# Altium schematic sheet Electrode_Sheet.SchDoc
size A4; SheetNumber: 4; SheetTotal: 4
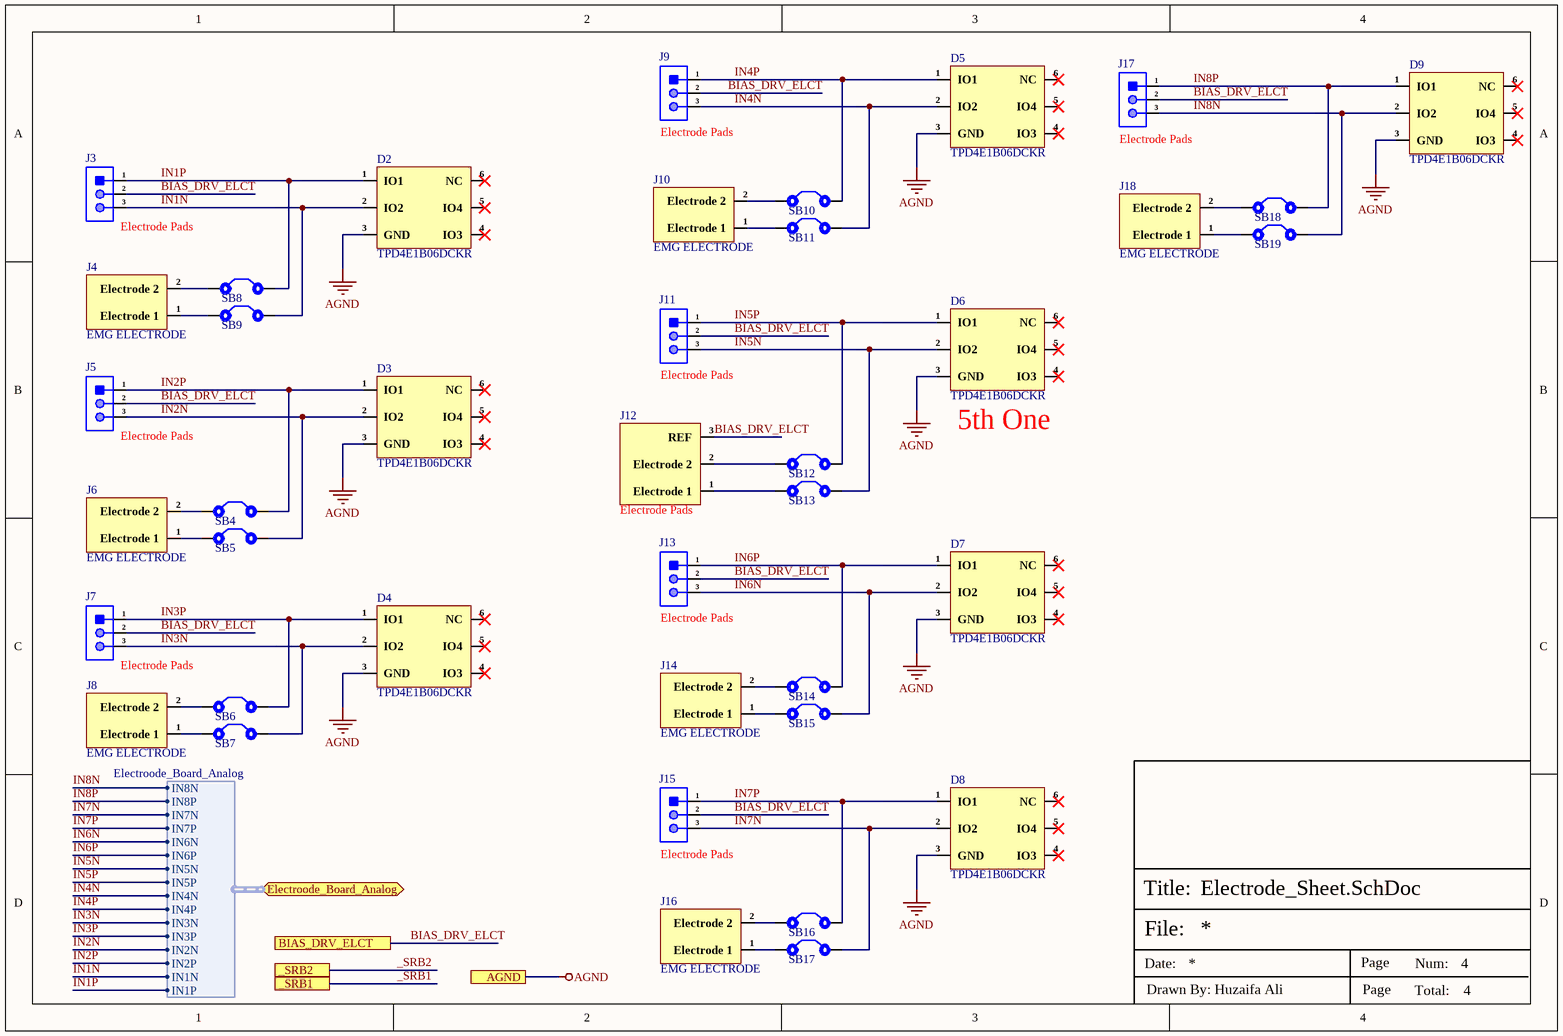
[diagram p0: Electrode_Sheet.SchDoc]

## Parts
D2  TPD4E1B06DCKR  [SOT-363]
D3  TPD4E1B06DCKR  [SOT-363]
D4  TPD4E1B06DCKR  [SOT-363]
D5  TPD4E1B06DCKR  [SOT-363]
D6  TPD4E1B06DCKR  [SOT-363]
D7  TPD4E1B06DCKR  [SOT-363]
D8  TPD4E1B06DCKR  [SOT-363]
D9  TPD4E1B06DCKR  [SOT-363]
J3  Test Pad SMD 3 Pin  [Test Pad (SMD 3 Pin)]  (value not drawn)  (no BOM)
J4  EMG ELECTRODE  [EMG 2 PAD]
J5  Test Pad SMD 3 Pin  [Test Pad (SMD 3 Pin)]  (value not drawn)  (no BOM)
J6  EMG ELECTRODE  [EMG 2 PAD]
J7  Test Pad SMD 3 Pin  [Test Pad (SMD 3 Pin)]  (value not drawn)  (no BOM)
J8  EMG ELECTRODE  [EMG 2 PAD]
J9  Test Pad SMD 3 Pin  [Test Pad (SMD 3 Pin)]  (value not drawn)  (no BOM)
J10  EMG ELECTRODE  [EMG 2 PAD]
J11  Test Pad SMD 3 Pin  [Test Pad (SMD 3 Pin)]  (value not drawn)  (no BOM)
J12  Electrode Pads  [EMG 3 Pad]
J13  Test Pad SMD 3 Pin  [Test Pad (SMD 3 Pin)]  (value not drawn)  (no BOM)
J14  EMG ELECTRODE  [EMG 2 PAD]
J15  Test Pad SMD 3 Pin  [Test Pad (SMD 3 Pin)]  (value not drawn)  (no BOM)
J16  EMG ELECTRODE  [EMG 2 PAD]
J17  Test Pad SMD 3 Pin  [Test Pad (SMD 3 Pin)]  (value not drawn)  (no BOM)
J18  EMG ELECTRODE  [EMG 2 PAD]
SB4  Solder Bridge 0603  [Solder Bridge]  (value not drawn)  (no BOM)
SB5  Solder Bridge 0603  [Solder Bridge]  (value not drawn)  (no BOM)
SB6  Solder Bridge 0603  [Solder Bridge]  (value not drawn)  (no BOM)
SB7  Solder Bridge 0603  [Solder Bridge]  (value not drawn)  (no BOM)
SB8  Solder Bridge 0603  [Solder Bridge]  (value not drawn)  (no BOM)
SB9  Solder Bridge 0603  [Solder Bridge]  (value not drawn)  (no BOM)
SB10  Solder Bridge 0603  [Solder Bridge]  (value not drawn)  (no BOM)
SB11  Solder Bridge 0603  [Solder Bridge]  (value not drawn)  (no BOM)
SB12  Solder Bridge 0603  [Solder Bridge]  (value not drawn)  (no BOM)
SB13  Solder Bridge 0603  [Solder Bridge]  (value not drawn)  (no BOM)
SB14  Solder Bridge 0603  [Solder Bridge]  (value not drawn)  (no BOM)
SB15  Solder Bridge 0603  [Solder Bridge]  (value not drawn)  (no BOM)
SB16  Solder Bridge 0603  [Solder Bridge]  (value not drawn)  (no BOM)
SB17  Solder Bridge 0603  [Solder Bridge]  (value not drawn)  (no BOM)
SB18  Solder Bridge 0603  [Solder Bridge]  (value not drawn)  (no BOM)
SB19  Solder Bridge 0603  [Solder Bridge]  (value not drawn)  (no BOM)

## Ports
_SRB1, _SRB2, AGND, BIAS_DRV_ELCT, Electroode_Board_Analog (bidir, harness Electroode_Board_Analog)

## Harnesses
Electroode_Board_Analog: IN8N, IN8P, IN7N, IN7P, IN6N, IN6P, IN5N, IN5P, IN4N, IN4P, IN3N, IN3P, IN2N, IN2P, IN1N, IN1P

## Nets
AGND: D2.3(GND) D3.3(GND) D4.3(GND) D5.3(GND) D6.3(GND) D7.3(GND) D8.3(GND) D9.3(GND) ; port AGND
_SRB1: port _SRB1
_SRB2: port _SRB2
BIAS_DRV_ELCT: J3.2 J5.2 J7.2 J9.2 J11.2 J12.3(REF) J13.2 J15.2 J17.2 ; port BIAS_DRV_ELCT
IN1N: D2.2(IO2) J3.3 SB9.2 ; port Electroode_Board_Analog.IN1N
IN1P: D2.1(IO1) J3.1 SB8.2 ; port Electroode_Board_Analog.IN1P
IN2N: D3.2(IO2) J5.3 SB5.2 ; port Electroode_Board_Analog.IN2N
IN2P: D3.1(IO1) J5.1 SB4.2 ; port Electroode_Board_Analog.IN2P
IN3N: D4.2(IO2) J7.3 SB7.2 ; port Electroode_Board_Analog.IN3N
IN3P: D4.1(IO1) J7.1 SB6.2 ; port Electroode_Board_Analog.IN3P
IN4N: D5.2(IO2) J9.3 SB11.2 ; port Electroode_Board_Analog.IN4N
IN4P: D5.1(IO1) J9.1 SB10.2 ; port Electroode_Board_Analog.IN4P
IN5N: D6.2(IO2) J11.3 SB13.2 ; port Electroode_Board_Analog.IN5N
IN5P: D6.1(IO1) J11.1 SB12.2 ; port Electroode_Board_Analog.IN5P
IN6N: D7.2(IO2) J13.3 SB15.2 ; port Electroode_Board_Analog.IN6N
IN6P: D7.1(IO1) J13.1 SB14.2 ; port Electroode_Board_Analog.IN6P
IN7N: D8.2(IO2) J15.3 SB17.2 ; port Electroode_Board_Analog.IN7N
IN7P: D8.1(IO1) J15.1 SB16.2 ; port Electroode_Board_Analog.IN7P
IN8N: D9.2(IO2) J17.3 SB19.2 ; port Electroode_Board_Analog.IN8N
IN8P: D9.1(IO1) J17.1 SB18.2 ; port Electroode_Board_Analog.IN8P
NetJ4_1: J4.1(Electrode_1) SB9.1
NetJ4_2: J4.2(Electrode_2) SB8.1
NetJ6_1: J6.1(Electrode_1) SB5.1
NetJ6_2: J6.2(Electrode_2) SB4.1
NetJ8_1: J8.1(Electrode_1) SB7.1
NetJ8_2: J8.2(Electrode_2) SB6.1
NetJ10_1: J10.1(Electrode_1) SB11.1
NetJ10_2: J10.2(Electrode_2) SB10.1
NetJ12_1: J12.1(Electrode_1) SB13.1
NetJ12_2: J12.2(Electrode_2) SB12.1
NetJ14_1: J14.1(Electrode_1) SB15.1
NetJ14_2: J14.2(Electrode_2) SB14.1
NetJ16_1: J16.1(Electrode_1) SB17.1
NetJ16_2: J16.2(Electrode_2) SB16.1
NetJ18_1: J18.1(Electrode_1) SB19.1
NetJ18_2: J18.2(Electrode_2) SB18.1

Not connected (* = marked no-connect by the designer): D2 4(IO3)* 5(IO4)* 6(NC)*; D3 4(IO3)* 5(IO4)* 6(NC)*; D4 4(IO3)* 5(IO4)* 6(NC)*; D5 4(IO3)* 5(IO4)* 6(NC)*; D6 4(IO3)* 5(IO4)* 6(NC)*; D7 4(IO3)* 5(IO4)* 6(NC)*; D8 4(IO3)* 5(IO4)* 6(NC)*; D9 4(IO3)* 5(IO4)* 6(NC)*

## Notes on the sheet
- (near J9) Electrode Pads
- (near J17) Electrode Pads
- (near J3) Electrode Pads
- (near J11) Electrode Pads
- (near J5) Electrode Pads
- (near D6) 5th One
- (near J13) Electrode Pads
- (near J7) Electrode Pads
- (near J15) Electrode Pads
- File:
- Title:
- Date:
- Page
- Num:
- Total:
- Drawn By: Huzaifa Ali

## Library data of the parts
D2-D9 = TPD4E1B06DCKR: TVS DIODE 5.5VWM 14.5VC SC706; Manufacturer: Texas Instruments; Item Type: IC; Supplier: Mouser; LCSC Part Number: C840093; Manufacturer Part Number: TPD4E1B06DCKR; RoHS: Yes; Stock: 26732; Pricing: 1=0.62, 10=0.453, 50=0.453, 100=0.31, 1000=0.236, 10000=0.195 (USD); ComponentLink1URL: https://datasheet.ciiva.com/6574/tpd4e1b06-6574671.pdf?src-supplier=Digikey; ComponentLink1Description: https://datasheet.ciiva.com/6574/tpd4e1b06-6574671.pdf?src-supplier=Digikey; ComponentLink2URL: https://datasheet.ciiva.com/12545/tpd4e1b06-224687-12545147.pdf?src-supplier=Mouser; ComponentLink2Description: https://datasheet.ciiva.com/12545/tpd4e1b06-224687-12545147.pdf?src-supplier=Mouser
J3 J5 J7 J9 J11 J13 J15 J17 = Test Pad SMD 3 Pin: Test Pad
J4 J6 J8 J10 J14 J16 J18 = EMG ELECTRODE: Sensor Connecting Pads
J12 = EMG ELECTRODE 3 Pin: Sensor Connecting Pads
SB4-SB19 = Solder Bridge 0603: Solder Bridge ON; Manufacturer Part Number: Solder Bridge; Item Type: Solder Bridge